# Altium schematic sheet RK3588-USB-Control.SchDoc
size 420 x 297 mm; SheetNumber: 8; SheetTotal: 22
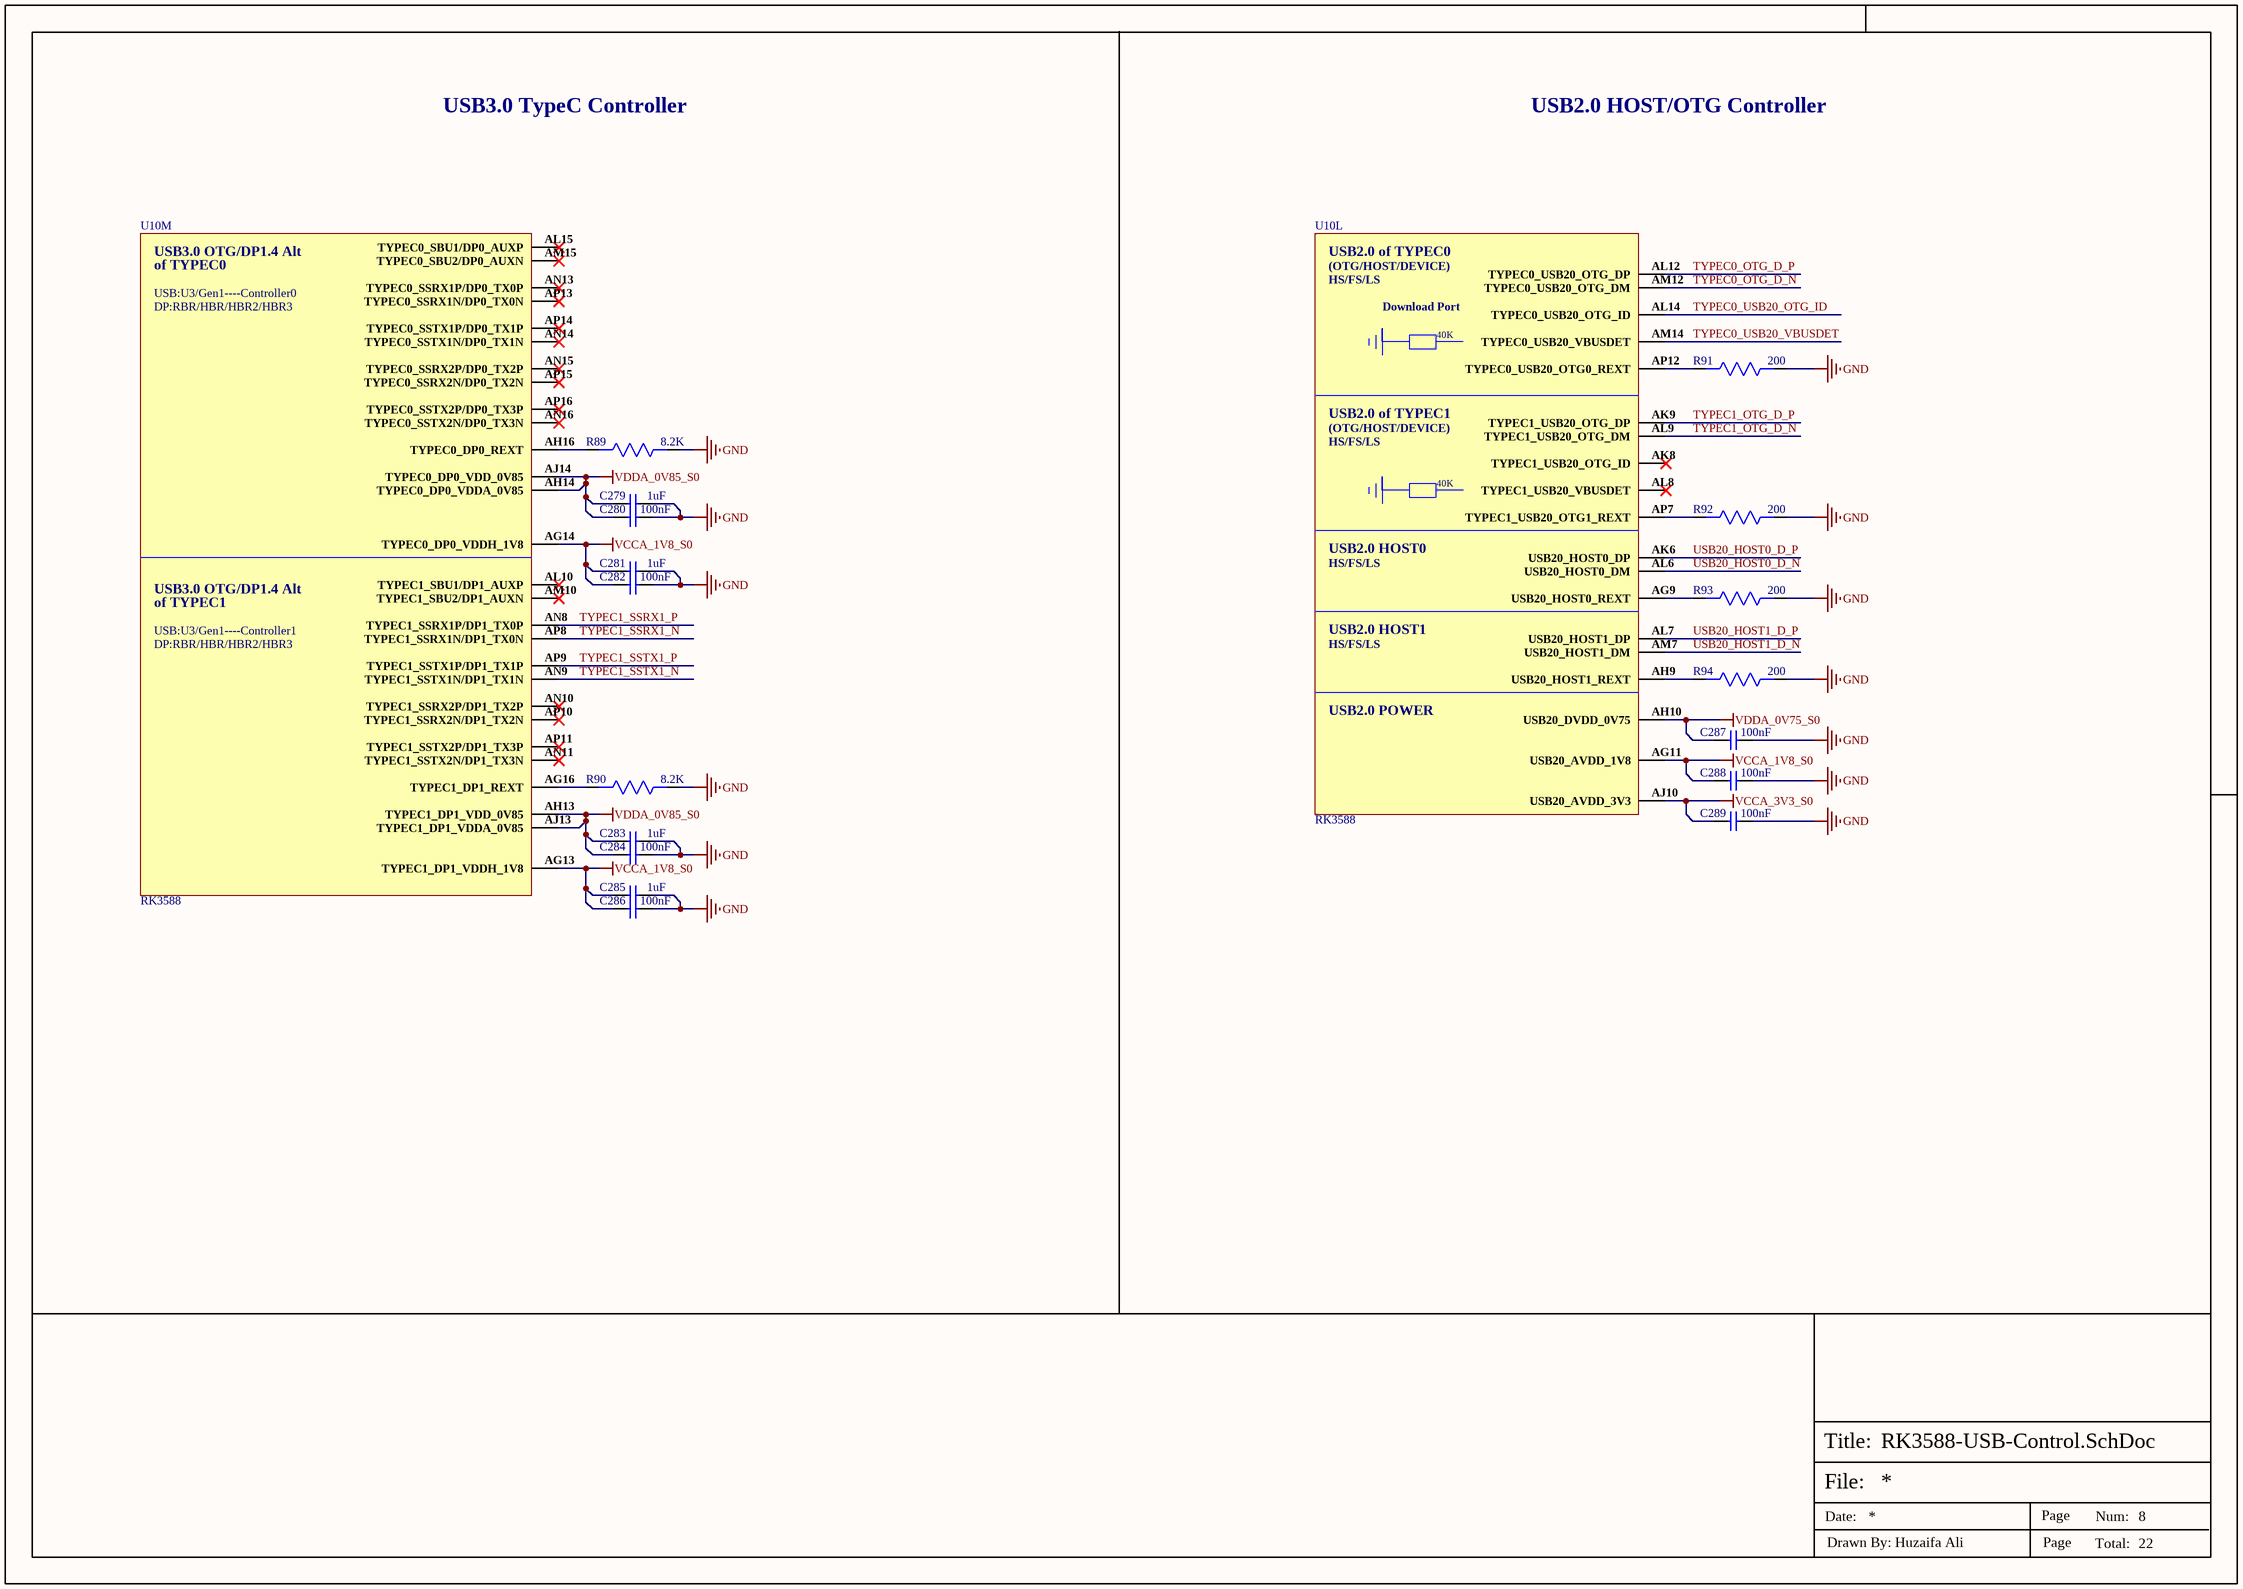
[diagram p0: RK3588-USB-Control.SchDoc]

## Parts
C279  1uF  [CAP-0201]
C280  100nF  [CAP-0201]
C281  1uF  [CAP-0201]
C282  100nF  [CAP-0201]
C283  1uF  [CAP-0201]
C284  100nF  [CAP-0201]
C285  1uF  [CAP-0201]
C286  100nF  [CAP-0201]
C287  100nF  [CAP-0201]
C288  100nF  [CAP-0201]
C289  100nF  [CAP-0201]
R89  8.2K  [Res-0201]
R90  8.2K  [Res-0201]
R91  200  [Res-0201]
R92  200  [Res-0201]
R93  200  [Res-0201]
R94  200  [Res-0201]
U10  RK3588  [FCBGA-1088L]  (parts L,M of 26)

## Nets
GND: C279.2 C280.2 C281.2 C282.2 C283.2 C284.2 C285.2 C286.2 C287.2 C288.2 C289.2 R89.1 R90.1 R91.1 R92.1 R93.1 R94.1
VCCA_1V8_S0: C281.1 C282.1 C285.1 C286.1 C288.1 U10.AG11(USB20_AVDD_1V8) U10.AG13(TYPEC1_DP1_VDDH_1V8) U10.AG14(TYPEC0_DP0_VDDH_1V8)
VCCA_3V3_S0: C289.1 U10.AJ10(USB20_AVDD_3V3)
VDDA_0V75_S0: C287.1 U10.AH10(USB20_DVDD_0V75)
VDDA_0V85_S0: C279.1 C280.1 C283.1 C284.1 U10.AH13(TYPEC1_DP1_VDD_0V85) U10.AH14(TYPEC0_DP0_VDDA_0V85) U10.AJ13(TYPEC1_DP1_VDDA_0V85) U10.AJ14(TYPEC0_DP0_VDD_0V85)
TYPEC0_OTG_D_N: U10.AM12(TYPEC0_USB20_OTG_DM)
TYPEC0_OTG_D_P: U10.AL12(TYPEC0_USB20_OTG_DP)
TYPEC0_USB20_OTG_ID: U10.AL14(TYPEC0_USB20_OTG_ID)
TYPEC0_USB20_VBUSDET: U10.AM14(TYPEC0_USB20_VBUSDET)
TYPEC1_OTG_D_N: U10.AL9(TYPEC1_USB20_OTG_DM)
TYPEC1_OTG_D_P: U10.AK9(TYPEC1_USB20_OTG_DP)
TYPEC1_SSRX1_N: U10.AP8(TYPEC1_SSRX1N/DP1_TX0N)
TYPEC1_SSRX1_P: U10.AN8(TYPEC1_SSRX1P/DP1_TX0P)
TYPEC1_SSTX1_N: U10.AN9(TYPEC1_SSTX1N/DP1_TX1N)
TYPEC1_SSTX1_P: U10.AP9(TYPEC1_SSTX1P/DP1_TX1P)
USB20_HOST0_D_N: U10.AL6(USB20_HOST0_DM)
USB20_HOST0_D_P: U10.AK6(USB20_HOST0_DP)
USB20_HOST1_D_N: U10.AM7(USB20_HOST1_DM)
USB20_HOST1_D_P: U10.AL7(USB20_HOST1_DP)
NetR89_2: R89.2 U10.AH16(TYPEC0_DP0_REXT)
NetR90_2: R90.2 U10.AG16(TYPEC1_DP1_REXT)
NetR91_2: R91.2 U10.AP12(TYPEC0_USB20_OTG0_REXT)
NetR92_2: R92.2 U10.AP7(TYPEC1_USB20_OTG1_REXT)
NetR93_2: R93.2 U10.AG9(USB20_HOST0_REXT)
NetR94_2: R94.2 U10.AH9(USB20_HOST1_REXT)

Not connected (* = marked no-connect by the designer): U10 AK8(TYPEC1_USB20_OTG_ID)* AL8(TYPEC1_USB20_VBUSDET)* AL10(TYPEC1_SBU1/DP1_AUXP)* AL15(TYPEC0_SBU1/DP0_AUXP)* AM10(TYPEC1_SBU2/DP1_AUXN)* AM15(TYPEC0_SBU2/DP0_AUXN)* AN10(TYPEC1_SSRX2P/DP1_TX2P)* AN11(TYPEC1_SSTX2N/DP1_TX3N)* AN13(TYPEC0_SSRX1P/DP0_TX0P)* AN14(TYPEC0_SSTX1N/DP0_TX1N)* AN15(TYPEC0_SSRX2P/DP0_TX2P)* AN16(TYPEC0_SSTX2N/DP0_TX3N)* AP10(TYPEC1_SSRX2N/DP1_TX2N)* AP11(TYPEC1_SSTX2P/DP1_TX3P)* AP13(TYPEC0_SSRX1N/DP0_TX0N)* AP14(TYPEC0_SSTX1P/DP0_TX1P)* AP15(TYPEC0_SSRX2N/DP0_TX2N)* AP16(TYPEC0_SSTX2P/DP0_TX3P)*

## Notes on the sheet
- USB3.0 TypeC Controller
- USB2.0 HOST/OTG Controller
- File:
- Title:
- Date:
- Page
- Num:
- Total:
- Drawn By: Huzaifa Ali
- (in symbol RK3588, part L) USB2.0 of TYPEC0; (OTG/HOST/DEVICE); HS/FS/LS; Download Port; 40K; USB2.0 of TYPEC1; USB2.0 HOST0; USB2.0 HOST1; USB2.0 POWER
- (in symbol RK3588, part M) USB3.0 OTG/DP1.4 Alt; of TYPEC0; USB:U3/Gen1----Controller0; DP:RBR/HBR/HBR2/HBR3; of TYPEC1; USB:U3/Gen1----Controller1

## Library data of the parts
C279 C281 C283 C285 = CC0201KRX5R5BB105: CAP CER 1UF 6.3V X5R 0201; Manufacturer: Yageo; Tolerance: 10%; Supplier 1: Digi-Key; Manufacturer Part Number: CC0201KRX5R5BB105; RoHS: Yes; Category: Ceramic Capacitors; Stock 1: 1909543; Pricing 1: 1=0.10000, 10=0.04600, 50=0.02500, 100=0.02050, 500=0.01464, 1000=0.01150, 2500=0.01045, 5000=0.00962 (USD); Mount: Surface Mount; Case/Package: 0201; Case Code (Imperial): 0201; Case Code (Metric): 0603; Min Operating Temperature: -55°C; Max Operating Temperature: 85°C; Packaging: Cut Tape; Capacitance: 1uF; Voltage Rating: 6.3V; RoHS Compliant: Yes; ComponentLink1URL: http://www.yageo.com/documents/recent/UPY-GPHC_X5R_4V-to-50V_25.pdf?src-supplier=Digi-Key; ComponentLink1Description: http://www.yageo.com/documents/recent/UPY-GPHC_X5R_4V-to-50V_25.pdf?src-supplier=Digi-Key; ComponentLink2URL: https://www.yageo.com/upload/media/product/productsearch/datasheet/mlcc/UPY-GPHC_X5R_4V-to-50V_26.pdf?src-supplier=Digi-Key; ComponentLink2Description: https://www.yageo.com/upload/media/product/productsearch/datasheet/mlcc/UPY-GPHC_X5R_4V-to-50V_26.pdf?src-supplier=Digi-Key; Supplier Part Number 1: 311-3471-1-ND
C280 C282 C284 C286-C289 = CC0201KRX5R5BB104: CAP CER 0.1UF 6.3V X5R 0201; Manufacturer: Yageo; Tolerance: 10%; Supplier 1: Digi-Key; Manufacturer Part Number: CC0201KRX5R5BB104; RoHS: Yes; Category: Ceramic Capacitors; Stock 1: 3711589; Pricing 1: 1=0.10000, 10=0.02100, 50=0.01160, 100=0.00960, 500=0.00682, 1000=0.00536, 2500=0.00487, 5000=0.00448 (USD); Mount: Surface Mount; Case/Package: 0201; Number of Pins: 2; Case Code (Imperial): 0201; Case Code (Metric): 0603; Min Operating Temperature: -55°C; Max Operating Temperature: 85°C; Capacitance: 100nF; Dielectric: X5R; Voltage Rating: 6.3V; Packaging: Tape and Reel; Package Quantity: 1; Voltage Rating (DC): 6.3V; Termination: SMD/SMT; Resistor Type: Ceramic; Series: CC; Length: 0.6mm; Width: 0.012inch; Height: 0.3mm; Thickness: 0.013inch; Depth: 0.3mm; Reach SVHC Compliant: Yes; Lead Free: Lead Free; Halogen Free: Halogen Free; RoHS Compliant: Yes; ComponentLink1URL: https://datasheet.ciiva.com/7656/1525783-7656597.pdf?src-supplier=Element14; ComponentLink1Description: https://datasheet.ciiva.com/7656/1525783-7656597.pdf?src-supplier=Element14; ComponentLink2URL: https://datasheet.ciiva.com/28450/1359354-28450200.pdf?src-supplier=Element14; ComponentLink2Description: https://datasheet.ciiva.com/28450/1359354-28450200.pdf?src-supplier=Element14; ComponentLink3URL: https://datasheet.ciiva.com/176/mlccorderingcode-176766.pdf?src-supplier=Digi-Key; ComponentLink3Description: https://datasheet.ciiva.com/176/mlccorderingcode-176766.pdf?src-supplier=Digi-Key; ComponentLink4URL: https://datasheet.ciiva.com/176/mlccorderingcode-176765.pdf?src-supplier=Digi-Key; ComponentLink4Description: https://datasheet.ciiva.com/176/mlccorderingcode-176765.pdf?src-supplier=Digi-Key; ComponentLink5URL: https://datasheet.ciiva.com/176/mlccorderingcode-176767.pdf?src-supplier=Digi-Key; ComponentLink5Description: https://datasheet.ciiva.com/176/mlccorderingcode-176767.pdf?src-supplier=Digi-Key; Supplier Part Number 1: 311-1408-1-ND
R89 R90 = RC0201FR-078K2L: RES 8.2K OHM 1% 1/20W 0201; Manufacturer: Yageo; Resistance: 8.2kR; Power Rating: 50mW; Voltage Rating: 25V; Temperature Coefficient: 200ppm/°C; Supplier 1: Digi-Key; Manufacturer Part Number: RC0201FR-078K2L; RoHS: Yes; Category: Chip SMD Resistors; Stock 1: 282340; Pricing 1: 1=0.10000, 10=0.03700, 100=0.01500, 1000=0.00672, 2500=0.00583, 5000=0.00482 (USD); Case/Package: 0201; Case Code (Metric): 0603; Case Code (Imperial): 0201; Min Operating Temperature: -55°C; Max Operating Temperature: 125°C; Package Quantity: 10000; Packaging: Tape and Reel; Tolerance: 1%; Resistor Type: Thick Film; Number of Terminations: 2; Termination: SMD/SMT; Max Power Dissipation: 50mW; Features: Moisture Resistant; Series: RC; Resistance Tolerance: 1%; Length: 0.024inch; Width: 0.3mm; Height: 0.01inch; Reach SVHC Compliant: Yes; Lead Free: Lead Free; RoHS Compliant: Yes; ComponentLink1URL: https://datasheet.ciiva.com/14985/pyu-r-int-thick-7-14985436.pdf?src-supplier=Digi-Key; ComponentLink1Description: https://datasheet.ciiva.com/14985/pyu-r-int-thick-7-14985436.pdf?src-supplier=Digi-Key; Supplier Part Number 1: YAG2353CT-ND
R91-R94 = RC0201FR-07200RL: RES 200 OHM 1% 1/20W 0201; Manufacturer: Yageo; Resistance: 200R; Voltage Rating: 25V; Power Rating: 50mW; Temperature Coefficient: 200ppm/°C; Supplier 1: Digi-Key; Manufacturer Part Number: RC0201FR-07200RL; RoHS: Yes; Category: Chip SMD Resistors; Stock 1: 400402; Pricing 1: 1=0.10000, 10=0.03700, 100=0.01500, 1000=0.00672, 2500=0.00583, 5000=0.00482 (USD); Case/Package: 0201; Case Code (Imperial): 0201; Case Code (Metric): 0603; Size Code: 0201; Min Operating Temperature: -55°C; Max Operating Temperature: 125°C; Package Quantity: 10000; Tolerance: 1%; Packaging: Tape and Reel; Resistor Type: Thick Film; Termination: SMD/SMT; Number of Terminations: 2; Max Power Dissipation: 50mW; Features: Moisture Resistant; Series: RC; Construction: Rectangular; Length: 0.6mm; Width: 0.3mm; Height: 0.01inch; Depth: 0.3mm; Military Standard: Not; Lead Free: Lead Free; RoHS Compliant: Yes; ComponentLink1URL: http://www.mouser.com/ds/2/447/RC0201-559633.pdf?src-supplier=Mouser; ComponentLink1Description: http://www.mouser.com/ds/2/447/RC0201-559633.pdf?src-supplier=Mouser; ComponentLink2URL: http://www.yageo.com/documents/recent/PYu-RC0201_51_RoHS_L_(8).pdf?src-supplier=Future+Electronics; ComponentLink2Description: http://www.yageo.com/documents/recent/PYu-RC0201_51_RoHS_L_(8).pdf?src-supplier=Future+Electronics; ComponentLink3URL: http://www.yageo.com/documents/recent/PYu-RC_Group_51_RoHS_L_10.pdf?src-supplier=Digi-Key; ComponentLink3Description: http://www.yageo.com/documents/recent/PYu-RC_Group_51_RoHS_L_10.pdf?src-supplier=Digi-Key; ComponentLink4URL: http://www.yageo.com/documents/recent/PYu-RC_Group_51_RoHS_L_9.pdf?src-supplier=Digi-Key; ComponentLink4Description: http://www.yageo.com/documents/recent/PYu-RC_Group_51_RoHS_L_9.pdf?src-supplier=Digi-Key; Supplier Part Number 1: YAG2495CT-ND
U10 = RK3588: Power Management IC; Manufacturer Part Number: RK3588LP4XEVB; Manufacturer: Rockchip; LCSC Part Number: *; Item Type: IC